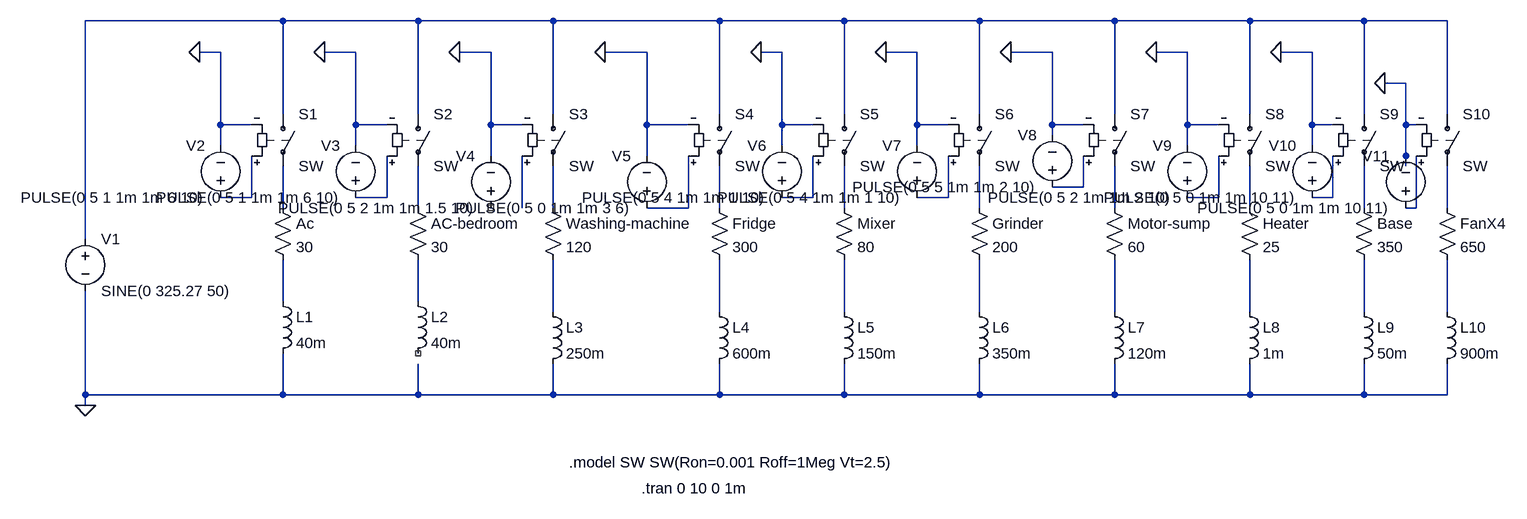
[diagram p0: schematic household-representation.asc]
household-representation.asc, the LTspice schematic file:
Version 4.1
SHEET 1 2276 680
WIRE 320 -224 16 -224
WIRE 528 -224 320 -224
WIRE 736 -224 528 -224
WIRE 992 -224 736 -224
WIRE 1184 -224 992 -224
WIRE 1392 -224 1184 -224
WIRE 1600 -224 1392 -224
WIRE 1808 -224 1600 -224
WIRE 1984 -224 1808 -224
WIRE 2112 -224 1984 -224
WIRE 224 -176 192 -176
WIRE 432 -176 384 -176
WIRE 640 -176 592 -176
WIRE 880 -176 816 -176
WIRE 1088 -176 1056 -176
WIRE 1296 -176 1248 -176
WIRE 1504 -176 1440 -176
WIRE 1712 -176 1664 -176
WIRE 1904 -176 1856 -176
WIRE 2048 -128 2016 -128
WIRE 320 -80 320 -224
WIRE 528 -80 528 -224
WIRE 736 -80 736 -224
WIRE 992 -80 992 -224
WIRE 1184 -80 1184 -224
WIRE 1392 -80 1392 -224
WIRE 1600 -80 1600 -224
WIRE 1808 -80 1808 -224
WIRE 1984 -80 1984 -224
WIRE 2112 -80 2112 -224
WIRE 224 -64 224 -176
WIRE 272 -64 224 -64
WIRE 432 -64 432 -176
WIRE 480 -64 432 -64
WIRE 640 -64 640 -176
WIRE 688 -64 640 -64
WIRE 880 -64 880 -176
WIRE 944 -64 880 -64
WIRE 1088 -64 1088 -176
WIRE 1136 -64 1088 -64
WIRE 1296 -64 1296 -176
WIRE 1344 -64 1296 -64
WIRE 1504 -64 1504 -176
WIRE 1552 -64 1504 -64
WIRE 1712 -64 1712 -176
WIRE 1760 -64 1712 -64
WIRE 1904 -64 1904 -176
WIRE 1936 -64 1904 -64
WIRE 2048 -64 2048 -128
WIRE 2064 -64 2048 -64
WIRE 1504 -48 1504 -64
WIRE 224 -32 224 -64
WIRE 432 -32 432 -64
WIRE 1088 -32 1088 -64
WIRE 1296 -32 1296 -64
WIRE 1712 -32 1712 -64
WIRE 1904 -32 1904 -64
WIRE 640 -16 640 -64
WIRE 880 -16 880 -64
WIRE 2048 -16 2048 -64
WIRE 2048 0 2048 -16
WIRE 1552 32 1552 -16
WIRE 1552 32 1504 32
WIRE 272 48 272 -16
WIRE 272 48 224 48
WIRE 480 48 480 -16
WIRE 480 48 432 48
WIRE 1136 48 1136 -16
WIRE 1136 48 1088 48
WIRE 1344 48 1344 -16
WIRE 1344 48 1296 48
WIRE 1760 48 1760 -16
WIRE 1760 48 1712 48
WIRE 1936 48 1936 -16
WIRE 1936 48 1904 48
WIRE 320 64 320 0
WIRE 528 64 528 0
WIRE 688 64 688 -16
WIRE 736 64 736 0
WIRE 944 64 944 -16
WIRE 944 64 880 64
WIRE 992 64 992 0
WIRE 1184 64 1184 0
WIRE 1392 64 1392 0
WIRE 1600 64 1600 0
WIRE 1808 64 1808 0
WIRE 1984 64 1984 0
WIRE 2064 64 2064 -16
WIRE 2064 64 2048 64
WIRE 2112 64 2112 0
WIRE 16 112 16 -224
WIRE 320 208 320 144
WIRE 528 208 528 144
WIRE 736 224 736 144
WIRE 992 224 992 144
WIRE 1184 224 1184 144
WIRE 1392 224 1392 144
WIRE 1600 224 1600 144
WIRE 1808 224 1808 144
WIRE 1984 224 1984 144
WIRE 2112 224 2112 144
WIRE 16 352 16 192
WIRE 320 352 320 288
WIRE 320 352 16 352
WIRE 528 352 528 304
WIRE 528 352 320 352
WIRE 736 352 736 304
WIRE 736 352 528 352
WIRE 992 352 992 304
WIRE 992 352 736 352
WIRE 1184 352 1184 304
WIRE 1184 352 992 352
WIRE 1392 352 1392 304
WIRE 1392 352 1184 352
WIRE 1600 352 1600 304
WIRE 1600 352 1392 352
WIRE 1808 352 1808 304
WIRE 1808 352 1600 352
WIRE 1984 352 1984 304
WIRE 1984 352 1808 352
WIRE 2112 352 2112 304
WIRE 2112 352 1984 352
WIRE 16 368 16 352
FLAG 16 368 0
FLAG 192 -176 0
FLAG 384 -176 0
FLAG 2016 -128 0
FLAG 1664 -176 0
FLAG 592 -176 0
FLAG 816 -176 0
FLAG 1056 -176 0
FLAG 1248 -176 0
FLAG 1440 -176 0
FLAG 1856 -176 0
SYMBOL res 512 48 R0
SYMATTR InstName AC-bedroom
SYMATTR Value 30
SYMBOL res 720 48 R0
SYMATTR InstName Washing-machine
SYMATTR Value 120
SYMBOL res 976 48 R0
SYMATTR InstName Fridge
SYMATTR Value 300
SYMBOL res 1168 48 R0
SYMATTR InstName Mixer
SYMATTR Value 80
SYMBOL res 1376 48 R0
SYMATTR InstName Grinder
SYMATTR Value 200
SYMBOL res 1584 48 R0
SYMATTR InstName Motor-sump
SYMATTR Value 60
SYMBOL res 1792 48 R0
SYMATTR InstName Heater
SYMATTR Value 25
SYMBOL res 1968 48 R0
SYMATTR InstName Base
SYMATTR Value 350
SYMBOL res 2096 48 R0
SYMATTR InstName FanX4
SYMATTR Value 650
SYMBOL sw 320 -96 R0
SYMATTR InstName S1
SYMBOL sw 528 -96 R0
SYMATTR InstName S2
SYMBOL sw 736 -96 R0
SYMATTR InstName S3
SYMBOL sw 992 -96 R0
SYMATTR InstName S4
SYMBOL sw 1184 -96 R0
SYMATTR InstName S5
SYMBOL sw 1392 -96 R0
SYMATTR InstName S6
SYMBOL sw 1600 -96 R0
SYMATTR InstName S7
SYMBOL sw 1808 -96 R0
SYMATTR InstName S8
SYMBOL sw 1984 -96 R0
SYMATTR InstName S9
SYMBOL sw 2112 -96 R0
SYMATTR InstName S10
SYMBOL ind 304 192 R0
SYMATTR InstName L1
SYMATTR Value 40m
SYMATTR SpiceLine Rser=1m
SYMBOL ind 512 192 R0
SYMATTR InstName L2
SYMATTR Value 40m
SYMATTR SpiceLine Rser=1m
SYMBOL ind 720 208 R0
SYMATTR InstName L3
SYMATTR Value 250m
SYMATTR SpiceLine Rser=1m
SYMBOL ind 976 208 R0
SYMATTR InstName L4
SYMATTR Value 600m
SYMATTR SpiceLine Rser=1m
SYMBOL ind 1168 208 R0
SYMATTR InstName L5
SYMATTR Value 150m
SYMATTR SpiceLine Rser=1m
SYMBOL ind 1376 208 R0
SYMATTR InstName L6
SYMATTR Value 350m
SYMATTR SpiceLine Rser=1m
SYMBOL ind 1584 208 R0
SYMATTR InstName L7
SYMATTR Value 120m
SYMATTR SpiceLine Rser=1m
SYMBOL ind 1792 208 R0
SYMATTR InstName L8
SYMATTR Value 1m
SYMATTR SpiceLine Rser=1m
SYMBOL ind 1968 208 R0
SYMATTR InstName L9
SYMATTR Value 50m
SYMATTR SpiceLine Rser=1m
SYMBOL ind 2096 208 R0
SYMATTR InstName L10
SYMATTR Value 900m
SYMATTR SpiceLine Rser=1m
SYMBOL voltage 224 64 R180
WINDOW 0 24 96 Left 2
WINDOW 3 24 16 Left 2
WINDOW 123 0 0 Left 0
WINDOW 39 0 0 Left 0
SYMATTR InstName V2
SYMATTR Value PULSE(0 5 1 1m 1m 6 10)
SYMBOL voltage 432 64 R180
WINDOW 0 24 96 Left 2
WINDOW 3 24 16 Left 2
WINDOW 123 0 0 Left 0
WINDOW 39 0 0 Left 0
SYMATTR InstName V3
SYMATTR Value PULSE(0 5 1 1m 1m 6 10)
SYMBOL voltage 640 80 R180
WINDOW 0 24 96 Left 2
WINDOW 3 24 16 Left 2
WINDOW 123 0 0 Left 0
WINDOW 39 0 0 Left 0
SYMATTR InstName V4
SYMATTR Value PULSE(0 5 2 1m 1m 1.5 10)
SYMBOL voltage 880 80 R180
WINDOW 0 24 96 Left 2
WINDOW 3 24 16 Left 2
WINDOW 123 0 0 Left 0
WINDOW 39 0 0 Left 0
SYMATTR InstName V5
SYMATTR Value PULSE(0 5 0 1m 1m 3 6)
SYMBOL voltage 1088 64 R180
WINDOW 0 24 96 Left 2
WINDOW 3 24 16 Left 2
WINDOW 123 0 0 Left 0
WINDOW 39 0 0 Left 0
SYMATTR InstName V6
SYMATTR Value PULSE(0 5 4 1m 1m 1 10)
SYMBOL voltage 1296 64 R180
WINDOW 0 24 96 Left 2
WINDOW 3 24 16 Left 2
WINDOW 123 0 0 Left 0
WINDOW 39 0 0 Left 0
SYMATTR InstName V7
SYMATTR Value PULSE(0 5 4 1m 1m 1 10)
SYMBOL voltage 1504 48 R180
WINDOW 0 24 96 Left 2
WINDOW 3 24 16 Left 2
WINDOW 123 0 0 Left 0
WINDOW 39 0 0 Left 0
SYMATTR InstName V8
SYMATTR Value PULSE(0 5 5 1m 1m 2 10)
SYMBOL voltage 1712 64 R180
WINDOW 0 24 96 Left 2
WINDOW 3 24 16 Left 2
WINDOW 123 0 0 Left 0
WINDOW 39 0 0 Left 0
SYMATTR InstName V9
SYMATTR Value PULSE(0 5 2 1m 1m 2 10)
SYMBOL voltage 1904 64 R180
WINDOW 0 24 96 Left 2
WINDOW 3 24 16 Left 2
WINDOW 123 0 0 Left 0
WINDOW 39 0 0 Left 0
SYMATTR InstName V10
SYMATTR Value PULSE(0 5 0 1m 1m 10 11)
SYMBOL voltage 2048 80 R180
WINDOW 0 24 96 Left 2
WINDOW 3 24 16 Left 2
WINDOW 123 0 0 Left 0
WINDOW 39 0 0 Left 0
SYMATTR InstName V11
SYMATTR Value PULSE(0 5 0 1m 1m 10 11)
SYMBOL voltage 16 96 R0
WINDOW 123 0 0 Left 0
WINDOW 39 0 0 Left 0
SYMATTR InstName V1
SYMATTR Value SINE(0 325.27 50)
SYMBOL res 304 48 R0
SYMATTR InstName Ac
SYMATTR Value 30
TEXT 872 496 Left 2 !.tran 0 10 0 1m
TEXT 760 456 Left 2 !.model SW SW(Ron=0.001 Roff=1Meg Vt=2.5)

The netlist it stands for:
* household-representation.asc
R§AC-bedroom N010 N023 30
R§Washing-machine N012 N024 120
R§Fridge N014 N025 300
R§Mixer N015 N026 80
R§Grinder N016 N027 200
R§Motor-sump N017 N028 60
R§Heater N018 N029 25
R§Base N019 N030 350
R§FanX4 N021 N031 650
S1 N001 N009 N003 0 SW
S2 N001 N010 N004 0 SW
S3 N001 N012 N011 0 SW
S4 N001 N014 N013 0 SW
S5 N001 N015 N005 0 SW
S6 N001 N016 N006 0 SW
S7 N001 N017 N002 0 SW
S8 N001 N018 N007 0 SW
S9 N001 N019 N008 0 SW
S10 N001 N021 N020 0 SW
L1 N022 0 40m Rser=1m
L2 N023 NC_01 40m Rser=1m
L3 N024 0 250m Rser=1m
L4 N025 0 600m Rser=1m
L5 N026 0 150m Rser=1m
L6 N027 0 350m Rser=1m
L7 N028 0 120m Rser=1m
L8 N029 0 1m Rser=1m
L9 N030 0 50m Rser=1m
L10 N031 0 900m Rser=1m
V2 N003 0 PULSE(0 5 1 1m 1m 6 10)
V3 N004 0 PULSE(0 5 1 1m 1m 6 10)
V4 NC_02 0 PULSE(0 5 2 1m 1m 1.5 10)
V5 N013 0 PULSE(0 5 0 1m 1m 3 6)
V6 N005 0 PULSE(0 5 4 1m 1m 1 10)
V7 N006 0 PULSE(0 5 4 1m 1m 1 10)
V8 N002 0 PULSE(0 5 5 1m 1m 2 10)
V9 N007 0 PULSE(0 5 2 1m 1m 2 10)
V10 N008 0 PULSE(0 5 0 1m 1m 10 11)
V11 N020 0 PULSE(0 5 0 1m 1m 10 11)
V1 N001 0 SINE(0 325.27 50)
R§Ac N009 N022 30
.tran 0 10 0 1m
.model SW SW(Ron=0.001 Roff=1Meg Vt=2.5)
.backanno
.end